# Altium schematic sheet MCU.SchDoc
size A4; SheetNumber: 2; SheetTotal: 5
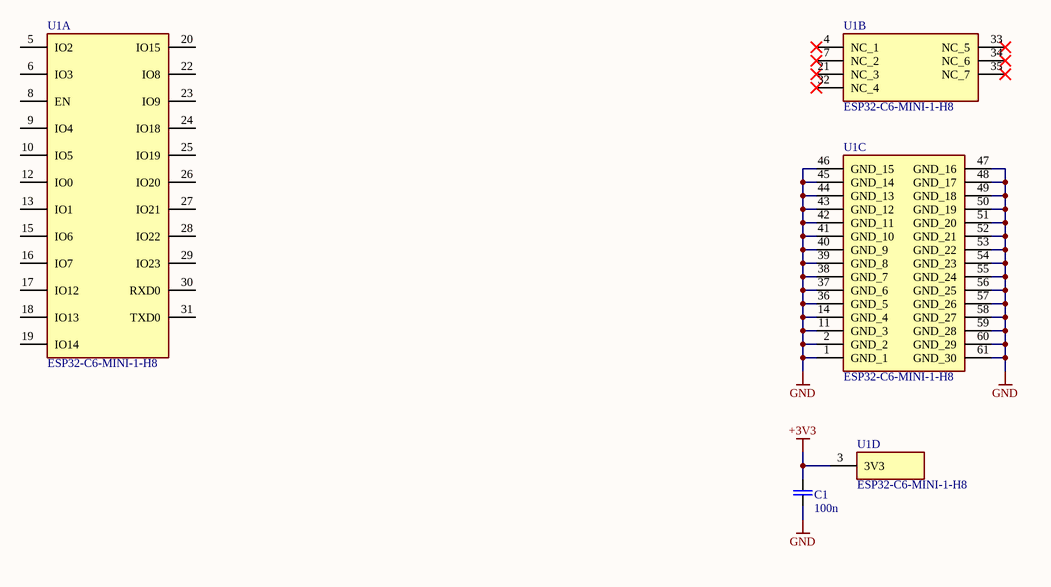
[diagram p0: MCU.SchDoc]

## Parts
C1  100n  [C0402]
U1  ESP32-C6-MINI-1-H8  [ESP32C6MINI1H8]  (parts A,B,C,D of 4)

## Nets
+3V3: C1.2 U1.3(3V3)
GND: C1.1 U1.1(GND_1) U1.2(GND_2) U1.11(GND_3) U1.14(GND_4) U1.36(GND_5) U1.37(GND_6) U1.38(GND_7) U1.39(GND_8) U1.40(GND_9) U1.41(GND_10) U1.42(GND_11) U1.43(GND_12) U1.44(GND_13) U1.45(GND_14) U1.46(GND_15) U1.47(GND_16) U1.48(GND_17) U1.49(GND_18) U1.50(GND_19) U1.51(GND_20) U1.52(GND_21) U1.53(GND_22) U1.54(GND_23) U1.55(GND_24) U1.56(GND_25) U1.57(GND_26) U1.58(GND_27) U1.59(GND_28) U1.60(GND_29) U1.61(GND_30)

Not connected (* = marked no-connect by the designer): U1 4(NC_1)* 5(IO2) 6(IO3) 7(NC_2)* 8(EN) 9(IO4) 10(IO5) 12(IO0) 13(IO1) 15(IO6) 16(IO7) 17(IO12) 18(IO13) 19(IO14) 20(IO15) 21(NC_3)* 22(IO8) 23(IO9) 24(IO18) 25(IO19) 26(IO20) 27(IO21) 28(IO22) 29(IO23) 30(RXD0) 31(TXD0) 32(NC_4)* 33(NC_5)* 34(NC_6)* 35(NC_7)*

## Library data of the parts
C1 = CMP-00023-15: Generic SMD 0402 Ceramic Capacitor
U1 = ESP32-C6-MINI-1-H8: 8 MB (Quad SPI) , 13.2  16.6  2.4 , 3.0 ~ 3.6 V , 2.4 GHz , 2412 ~ 2484 MHz , 40C ~ 105C; Manufacturer_Name: Espressif Systems; Geometry.Height: 2.55mm; Mouser Part Number: 356-ESP32C6MINI1H8; Mouser Price/Stock: https://www.mouser.co.uk/ProductDetail/Espressif-Systems/ESP32-C6-MINI-1-H8?qs=olJun0bQHM8q1UR%2FHSWi2A%3D%3D; Manufacturer_Part_Number: ESP32-C6-MINI-1-H8; Datasheet Link: https://www.mouser.ph/ProductDetail/Espressif-Systems/ESP32-C6-MINI-1-H8?qs=olJun0bQHM8q1UR%2FHSWi2A%3D%3D